# Altium schematic sheet Sheet2.SchDoc
size A4; SheetNumber: 1; SheetTotal: 1
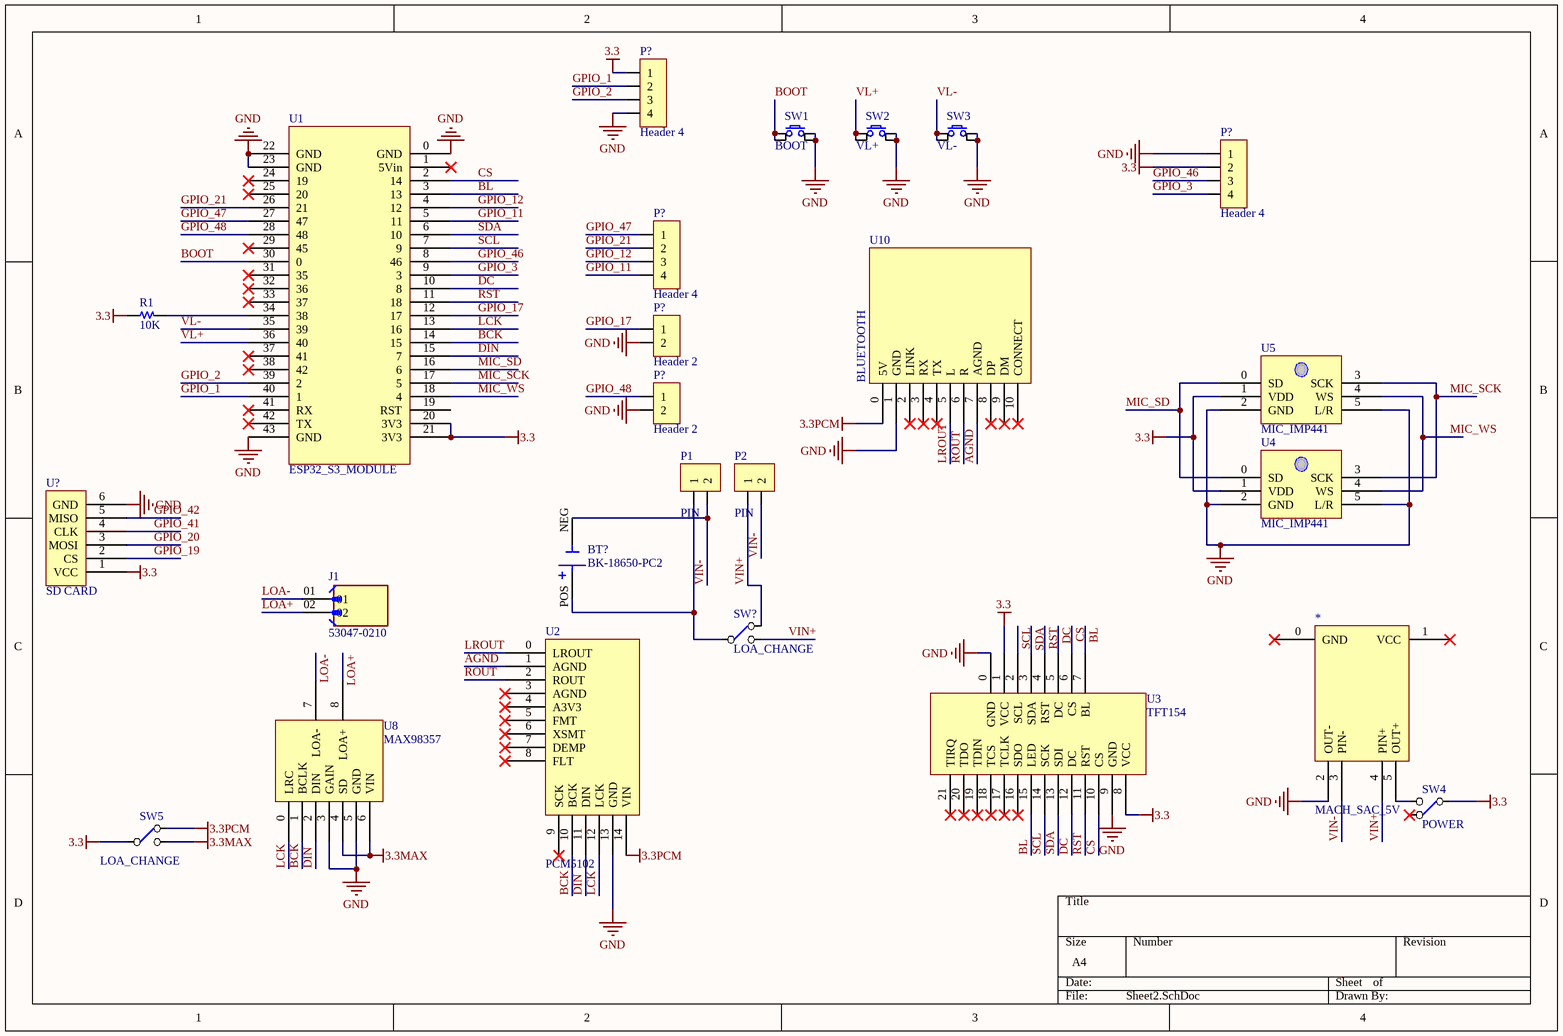
[diagram p0: Sheet2.SchDoc]

## Parts
(Parts that share a designator on the sheet are numbered #1, #2 ... from top to bottom, then left to right.)
*  MACH_SAC_5V  [TP4056]
BT?  BK-18650-PC2  [BAT_BK-18650-PC2]
J1  53047-0210  [MOLEX_53047-0210]
P1  PIN  [HDR/Header/2/BOX]
P2  PIN  [HDR/Header/2/BOX]
P?#1  Header 4  [HDR/Header/4/BOX/SMD]
P?#2  Header 4  [HDR/Header/4/BOX/SMD]
P?#3  Header 4  [HDR/Header/4/BOX/SMD]
P?#4  Header 2  [HDR/Header/2]
P?#5  Header 2  [HDR/Header/2]
R1  10K  [R 1/4W/300]
SW1  BOOT  [SW/4/06MM]
SW2  VL+  [SW/4/06MM]
SW3  VL-  [SW/4/06MM]
SW4  POWER  [SW/3/SPDT/SS12D10]
SW5  LOA_CHANGE  [SW/3/SPDT/SS12D10]
SW?  LOA_CHANGE  [SW/3/SPDT/SS12D10]
U1  ESP32_S3_MODULE  [ESP32_S3_MODULE]
U2  PCM5102  [PCM5102]
U3  TFT154  [TFT]
U4  MIC_IMP441  [IMP441]
U5  MIC_IMP441  [IMP441]
U8  MAX98357  [MAX98357]
U10  BLUETOOTH  [BLE]
U?  SD CARD  [SDCARD_MODULE]

## Nets
3.3: P?#1.1 P?#2.2 R1.1 SW4.2(COMMON1) SW5.2(COMMON1) U1.20(3V3) U1.21(3V3) U3.1(VCC) U3.8(VCC) U4.1(VDD) U5.1(VDD) U?.1(VCC)
3.3MAX: SW5.3(NO1) U8.4(SD) U8.6(VIN)
3.3PCM: SW5.1(NC1) U2.14(VIN) U10.0(5V)
GND: *.2(OUT-) P?#1.4 P?#2.1 P?#4.2 P?#5.2 SW1.3 SW1.4 SW2.3 SW2.4 SW3.3 SW3.4 U1.0(GND) U1.22(GND) U1.23(GND) U1.43(GND) U2.13(GND) U3.0(GND) U3.9(GND) U4.2(GND) U4.5(L/R) U5.2(GND) U5.5(L/R) U8.3(GAIN) U8.5(GND) U10.1(GND) U?.6(GND)
AGND: U2.1(AGND) U10.7(AGND)
BCK: U1.14(15) U2.10(BCK) U8.1(BCLK)
BL: U1.3(13) U3.7(BL) U3.15(LED)
BOOT: SW1.1 SW1.2 U1.30(0)
CS: U1.2(14) U3.6(CS) U3.10(CS)
DC: U1.10(8) U3.5(DC) U3.12(DC)
DIN: U1.15(7) U2.11(DIN) U8.2(DIN)
GPIO_1: P?#1.2 U1.40(1)
GPIO_2: P?#1.3 U1.39(2)
GPIO_3: P?#2.4 U1.9(3)
GPIO_11: P?#3.4 U1.5(11)
GPIO_12: P?#3.3 U1.4(12)
GPIO_17: P?#4.1 U1.12(17)
GPIO_19: U?.2(CS)
GPIO_20: U?.3(MOSI)
GPIO_21: P?#3.2 U1.26(21)
GPIO_41: U?.4(CLK)
GPIO_42: U?.5(MISO)
GPIO_46: P?#2.3 U1.8(46)
GPIO_47: P?#3.1 U1.27(47)
GPIO_48: P?#5.1 U1.28(48)
LCK: U1.13(16) U2.12(LCK) U8.0(LRC)
LOA+: J1.02 U8.8(LOA+)
LOA-: J1.01 U8.7(LOA-)
LROUT: U2.0(LROUT) U10.5(L)
MIC_SCK: U1.17(5) U4.3(SCK) U5.3(SCK)
MIC_SD: U1.16(6) U4.0(SD) U5.0(SD)
MIC_WS: U1.18(4) U4.4(WS) U5.4(WS)
ROUT: U2.2(ROUT) U10.6(R)
RST: U1.11(18) U3.4(RST) U3.11(RST)
SCL: U1.7(9) U3.2(SCL) U3.14(SCK)
SDA: U1.6(10) U3.3(SDA) U3.13(SDI)
VIN+: *.4(PIN+) P2.1 SW?.1(NC1) SW?.3(NO1)
VIN-: *.3(PIN-) BT?.NEG P1.2 P2.2
VL+: SW2.1 SW2.2 U1.36(40)
VL-: SW3.1 SW3.2 U1.35(39)
Net*_5: *.5(OUT+) SW4.3(NO1)
NetBT?_POS: BT?.POS P1.1 SW?.2(COMMON1)
NetR1_2: R1.2 U1.34(38)

Not connected (* = marked no-connect by the designer): * 0(GND)* 1(VCC)*; SW4 1(NC1)*; U1 1(5Vin)* 19(RST) 24(19)* 25(20)* 29(45)* 31(35)* 32(36)* 33(37)* 37(41)* 38(42)* 41(RX)* 42(TX)*; U2 3(AGND)* 4(A3V3)* 5(FMT)* 6(XSMT)* 7(DEMP)* 8(FLT)* 9(SCK)*; U3 16(SDO)* 17(TCLK)* 18(TCS)* 19(TDIN)* 20(TDO)* 21(TIRQ)*; U10 2(LINK)* 3(RX)* 4(TX)* 8(DP)* 9(DM)* 10(CONNECT)*

## Library data of the parts
BT? = BK-18650-PC2: Battery Holder (Open) 18650 1 Cell PC Pin; MF: MPD (Memory; SnapEDA_Link: https://www.snapeda.com/parts/BK-18650-PC2/MPD/view-part/?ref=snap; Package: DFN-14 MPD (Memory Protection Devices); Value: *; MP: BK-18650-PC2; Check_prices: https://www.snapeda.com/parts/BK-18650-PC2/MPD/view-part/?ref=eda
J1 = 53047-0210: .049 pitch picoblade wire to board header, vt 2 circuits | Molex Incorporated 53047-0210; SnapEDA_Link: https://www.snapeda.com/parts/53047-0210/Molex/view-part/?ref=snap; Package: None; Value: *; MF: Molex; MP: 53047-0210; Check_prices: https://www.snapeda.com/parts/53047-0210/Molex/view-part/?ref=eda
P1 P2 P?#4 P?#5 = Header 2: Header, 2-Pin
P?#1-P?#3 = Header 4: Header, 4-Pin
R1 = Resistor
SW1-SW3 = SW SPST 4-pin: Tact switch 4-pin
SW4 SW5 SW? = SW SPDT
U? = SD Card Module